# Altium schematic sheet DDC.SchDoc
size A4
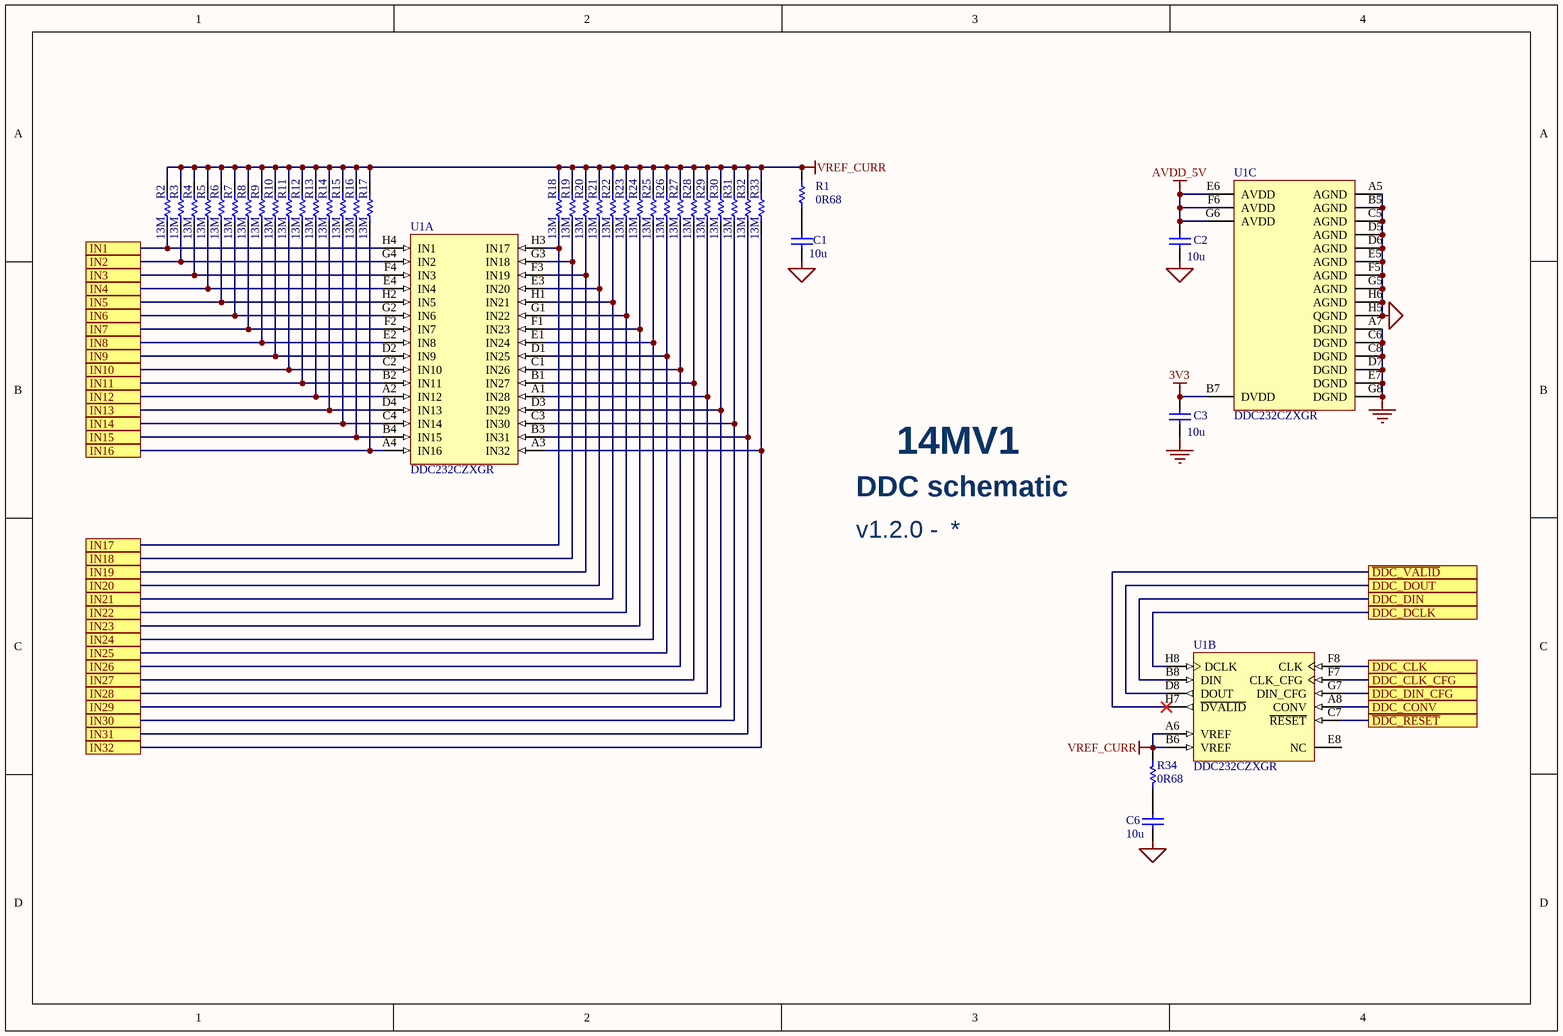
[diagram p0: DDC.SchDoc]

## Parts
C1  10u  [0603]
C2  10u  [0603]
C3  10u  [0603]
C6  10u  [0603]
R1  0R68  [0402]
R2  13M  [0402]
R3  13M  [0402]
R4  13M  [0402]
R5  13M  [0402]
R6  13M  [0402]
R7  13M  [0402]
R8  13M  [0402]
R9  13M  [0402]
R10  13M  [0402]
R11  13M  [0402]
R12  13M  [0402]
R13  13M  [0402]
R14  13M  [0402]
R15  13M  [0402]
R16  13M  [0402]
R17  13M  [0402]
R18  13M  [0402]
R19  13M  [0402]
R20  13M  [0402]
R21  13M  [0402]
R22  13M  [0402]
R23  13M  [0402]
R24  13M  [0402]
R25  13M  [0402]
R26  13M  [0402]
R27  13M  [0402]
R28  13M  [0402]
R29  13M  [0402]
R30  13M  [0402]
R31  13M  [0402]
R32  13M  [0402]
R33  13M  [0402]
R34  0R68  [0402]
U1  DDC232CZXGR  [TI-ZXG64]  (parts A,B,C of 3)

## Ports
DDC_CLK, DDC_CLK_CFG, DDC_CONV, DDC_DCLK, DDC_DIN, DDC_DIN_CFG, DDC_DOUT, IN1, IN2, IN3, IN4, IN5, IN6, IN7, IN8, IN9, IN10, IN11, IN12, IN13, IN14, IN15, IN16, IN17, IN18, IN19, IN20, IN21, IN22, IN23, IN24, IN25, IN26, IN27, IN28, IN29, IN30, IN31, IN32, ~{DDC_RESET}, ~{DDC_VALID}

## Nets
3V3: C3.2 U1.B7(DVDD)
AGND: C1.2 C2.1 C6.2 U1.A5(AGND) U1.B5(AGND) U1.C5(AGND) U1.D5(AGND) U1.D6(AGND) U1.E5(AGND) U1.F5(AGND) U1.G5(AGND) U1.H5(QGND) U1.H6(AGND)
AVDD_5V: C2.2 U1.E6(AVDD) U1.F6(AVDD) U1.G6(AVDD)
GND: C3.1 U1.A7(DGND) U1.C6(DGND) U1.C8(DGND) U1.D7(DGND) U1.E7(DGND) U1.G8(DGND)
VREF_CURR: R1.2 R2.2 R3.2 R4.2 R5.2 R6.2 R7.2 R8.2 R9.2 R10.2 R11.2 R12.2 R13.2 R14.2 R15.2 R16.2 R17.2 R18.2 R19.2 R20.2 R21.2 R22.2 R23.2 R24.2 R25.2 R26.2 R27.2 R28.2 R29.2 R30.2 R31.2 R32.2 R33.2 R34.2 U1.A6(VREF) U1.B6(VREF)
~{DDC_RESET}: U1.C7(~{RESET}) ; port ~{DDC_RESET}
~{DDC_VALID}: U1.H7(~{DVALID}) ; port ~{DDC_VALID}
DDC_CLK: U1.F8(CLK) ; port DDC_CLK
DDC_CLK_CFG: U1.F7(CLK_CFG) ; port DDC_CLK_CFG
DDC_CONV: U1.A8(CONV) ; port DDC_CONV
DDC_DCLK: U1.H8(DCLK) ; port DDC_DCLK
DDC_DIN: U1.B8(DIN) ; port DDC_DIN
DDC_DIN_CFG: U1.G7(DIN_CFG) ; port DDC_DIN_CFG
DDC_DOUT: U1.D8(DOUT) ; port DDC_DOUT
IN1: R2.1 U1.H4(IN1) ; port IN1
IN2: R3.1 U1.G4(IN2) ; port IN2
IN3: R4.1 U1.F4(IN3) ; port IN3
IN4: R5.1 U1.E4(IN4) ; port IN4
IN5: R6.1 U1.H2(IN5) ; port IN5
IN6: R7.1 U1.G2(IN6) ; port IN6
IN7: R8.1 U1.F2(IN7) ; port IN7
IN8: R9.1 U1.E2(IN8) ; port IN8
IN9: R10.1 U1.D2(IN9) ; port IN9
IN10: R11.1 U1.C2(IN10) ; port IN10
IN11: R12.1 U1.B2(IN11) ; port IN11
IN12: R13.1 U1.A2(IN12) ; port IN12
IN13: R14.1 U1.D4(IN13) ; port IN13
IN14: R15.1 U1.C4(IN14) ; port IN14
IN15: R16.1 U1.B4(IN15) ; port IN15
IN16: R17.1 U1.A4(IN16) ; port IN16
IN17: R18.1 U1.H3(IN17) ; port IN17
IN18: R19.1 U1.G3(IN18) ; port IN18
IN19: R20.1 U1.F3(IN19) ; port IN19
IN20: R21.1 U1.E3(IN20) ; port IN20
IN21: R22.1 U1.H1(IN21) ; port IN21
IN22: R23.1 U1.G1(IN22) ; port IN22
IN23: R24.1 U1.F1(IN23) ; port IN23
IN24: R25.1 U1.E1(IN24) ; port IN24
IN25: R26.1 U1.D1(IN25) ; port IN25
IN26: R27.1 U1.C1(IN26) ; port IN26
IN27: R28.1 U1.B1(IN27) ; port IN27
IN28: R29.1 U1.A1(IN28) ; port IN28
IN29: R30.1 U1.D3(IN29) ; port IN29
IN30: R31.1 U1.C3(IN30) ; port IN30
IN31: R32.1 U1.B3(IN31) ; port IN31
IN32: R33.1 U1.A3(IN32) ; port IN32
NetC1_1: C1.1 R1.1
NetC6_1: C6.1 R34.1

Not connected (* = marked no-connect by the designer): U1 E8(NC)

## Notes on the sheet
- DDC schematic
- 14MV1
- v1.2.0 -

## Library data of the parts
C1-C3 C6 = Cap 10uF: Capacitor MLCC 25V 10%; Published: 8-Jun-2000; LatestRevisionDate: 17-Jul-2002; LatestRevisionNote: Re-released for DXP Platform.; Publisher: Altium Limited
R1 R34 = Res 0R68: Resistor 0.1W 1%; Published: 8-Jun-2000; Publisher: Altium Limited; Value: 0R68; LatestRevisionDate: 17-Jul-2002; LatestRevisionNote: Re-released for DXP Platform.; PackageReference: AXIAL-0.3; PackageDescription: Axial Device, Thru-Hole; 2 Leads; 0.3 in Pin Spacing
R2-R33 = Res 13M: Resistor 0.1W 1%; Published: 8-Jun-2000; Publisher: Altium Limited; Value: 13M; LatestRevisionDate: 17-Jul-2002; LatestRevisionNote: Re-released for DXP Platform.; PackageReference: AXIAL-0.3; PackageDescription: Axial Device, Thru-Hole; 2 Leads; 0.3 in Pin Spacing
U1 = DDC232: 32 Channel Current-Input 20-Bit ADC, 0 to 70 degC, 64-pin BGA (ZXG64), Green (RoHS & no Sb/Br); Manufacturer: Texas Instruments; Resolution(Bits): 20; Analog Voltage AV/DD(Max)(V): 5.25; Digital Supply(Max)(V): 3.6; Architecture: Delta-Sigma; Digital Supply(Min)(V): 2.7; Sample Rate (max)(SPS): 3.125k; # Input Channels: 32; SubFamily: Low Power, 8-Bit, Dual 1.5 GSPS or Single 3.0 GSPS A/D Converter; Analog Voltage AV/DD(Min)(V): 4.75; ComponentLink3URL: http://www.ti.com/litv/pdf/mpbg581; ComponentLink1URL: http://www.ti.com/; ComponentLink2Description: Datasheet; PackageDescription: 64-Pin Plastic Ball Grid Array, Body 8 x 8 mm, Pitch 0.8 mm; ComponentLink2URL: http://www.ti.com/general/docs/lit/getliterature.tsp?genericPartNumber=DDC232&fileType=pdf; PartNumber: DDC232CZXGR; Eco-Plan: Green (RoHS & no Sb/Br); Mounting Technology: Surface Mount; PackageVersion: 4206838/A, 02/2005; PackageReference: ZXG64; ComponentLink1Description: Manufacturer URL; DatasheetVersion: SBAS331D; ComponentLink3Description: Package Specification; Manufacturer Part Number: DDC232CZXGR; Supplier 1: Digi-Key; Supplier Part Number 1: 296-23858-1-ND